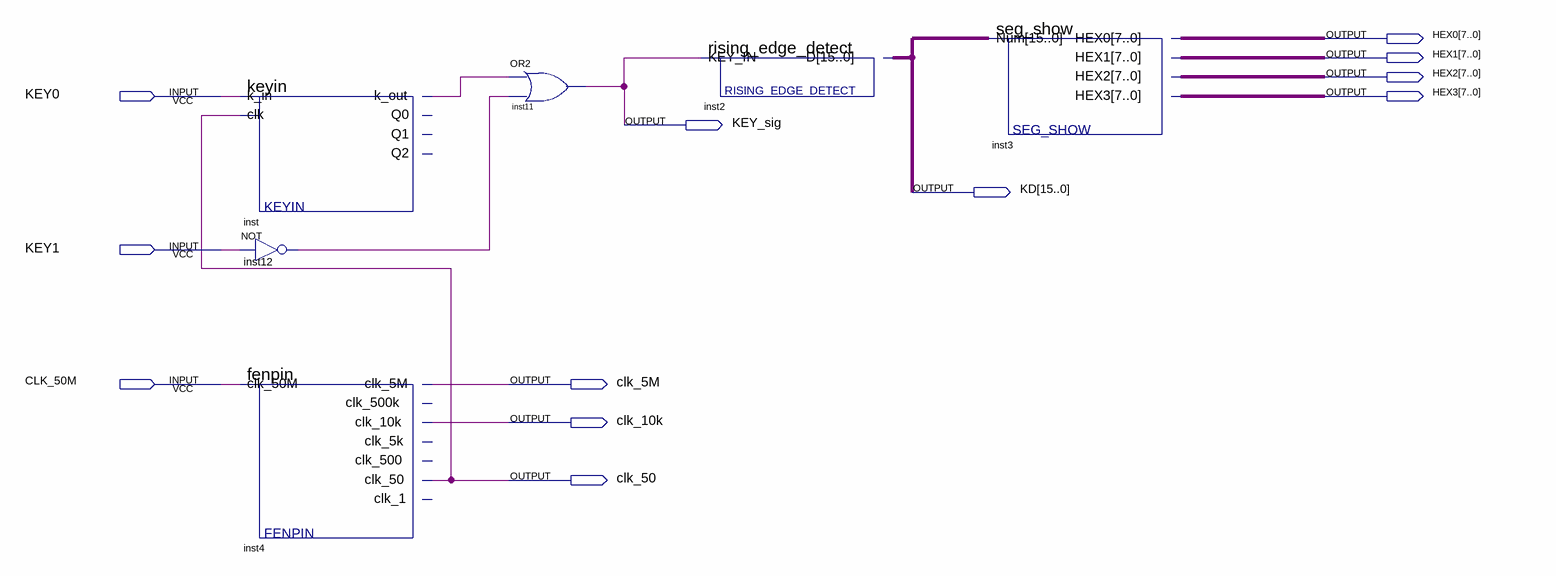
[diagram p0: schematic sheet]
// Quartus schematic exp5_top.bdf as structural Verilog: 6 symbols, 12 pins
module exp5_top (
  input  KEY0,
  input  KEY1,
  input  CLK_50M,
  output [7:0] HEX0,
  output [7:0] HEX1,
  output [7:0] HEX2,
  output [7:0] HEX3,
  output KEY_sig,
  output [15:0] KD,
  output clk_5M,
  output clk_10k,
  output clk_50
);

  wire inst12_out, inst_k_out;

  keyin inst (.k_in(KEY0), .clk(clk_50), .k_out(inst_k_out));  // open: Q0, Q1, Q2
  not inst12 (inst12_out, KEY1);
  fenpin inst4 (
    .clk_50M(CLK_50M), .clk_5M(clk_5M), .clk_10k(clk_10k), .clk_50(clk_50));  // open: clk_500k, clk_5k, clk_500, clk_1
  or inst11 (KEY_sig, inst_k_out, inst12_out);
  rising_edge_detect inst2 (.KEY_IN(KEY_sig), .D(KD));
  seg_show inst3 (.Num(KD), .HEX0(HEX0), .HEX1(HEX1), .HEX2(HEX2), .HEX3(HEX3));
endmodule
